# Altium schematic sheet OPA4377 - 副本.SchDoc
size A2
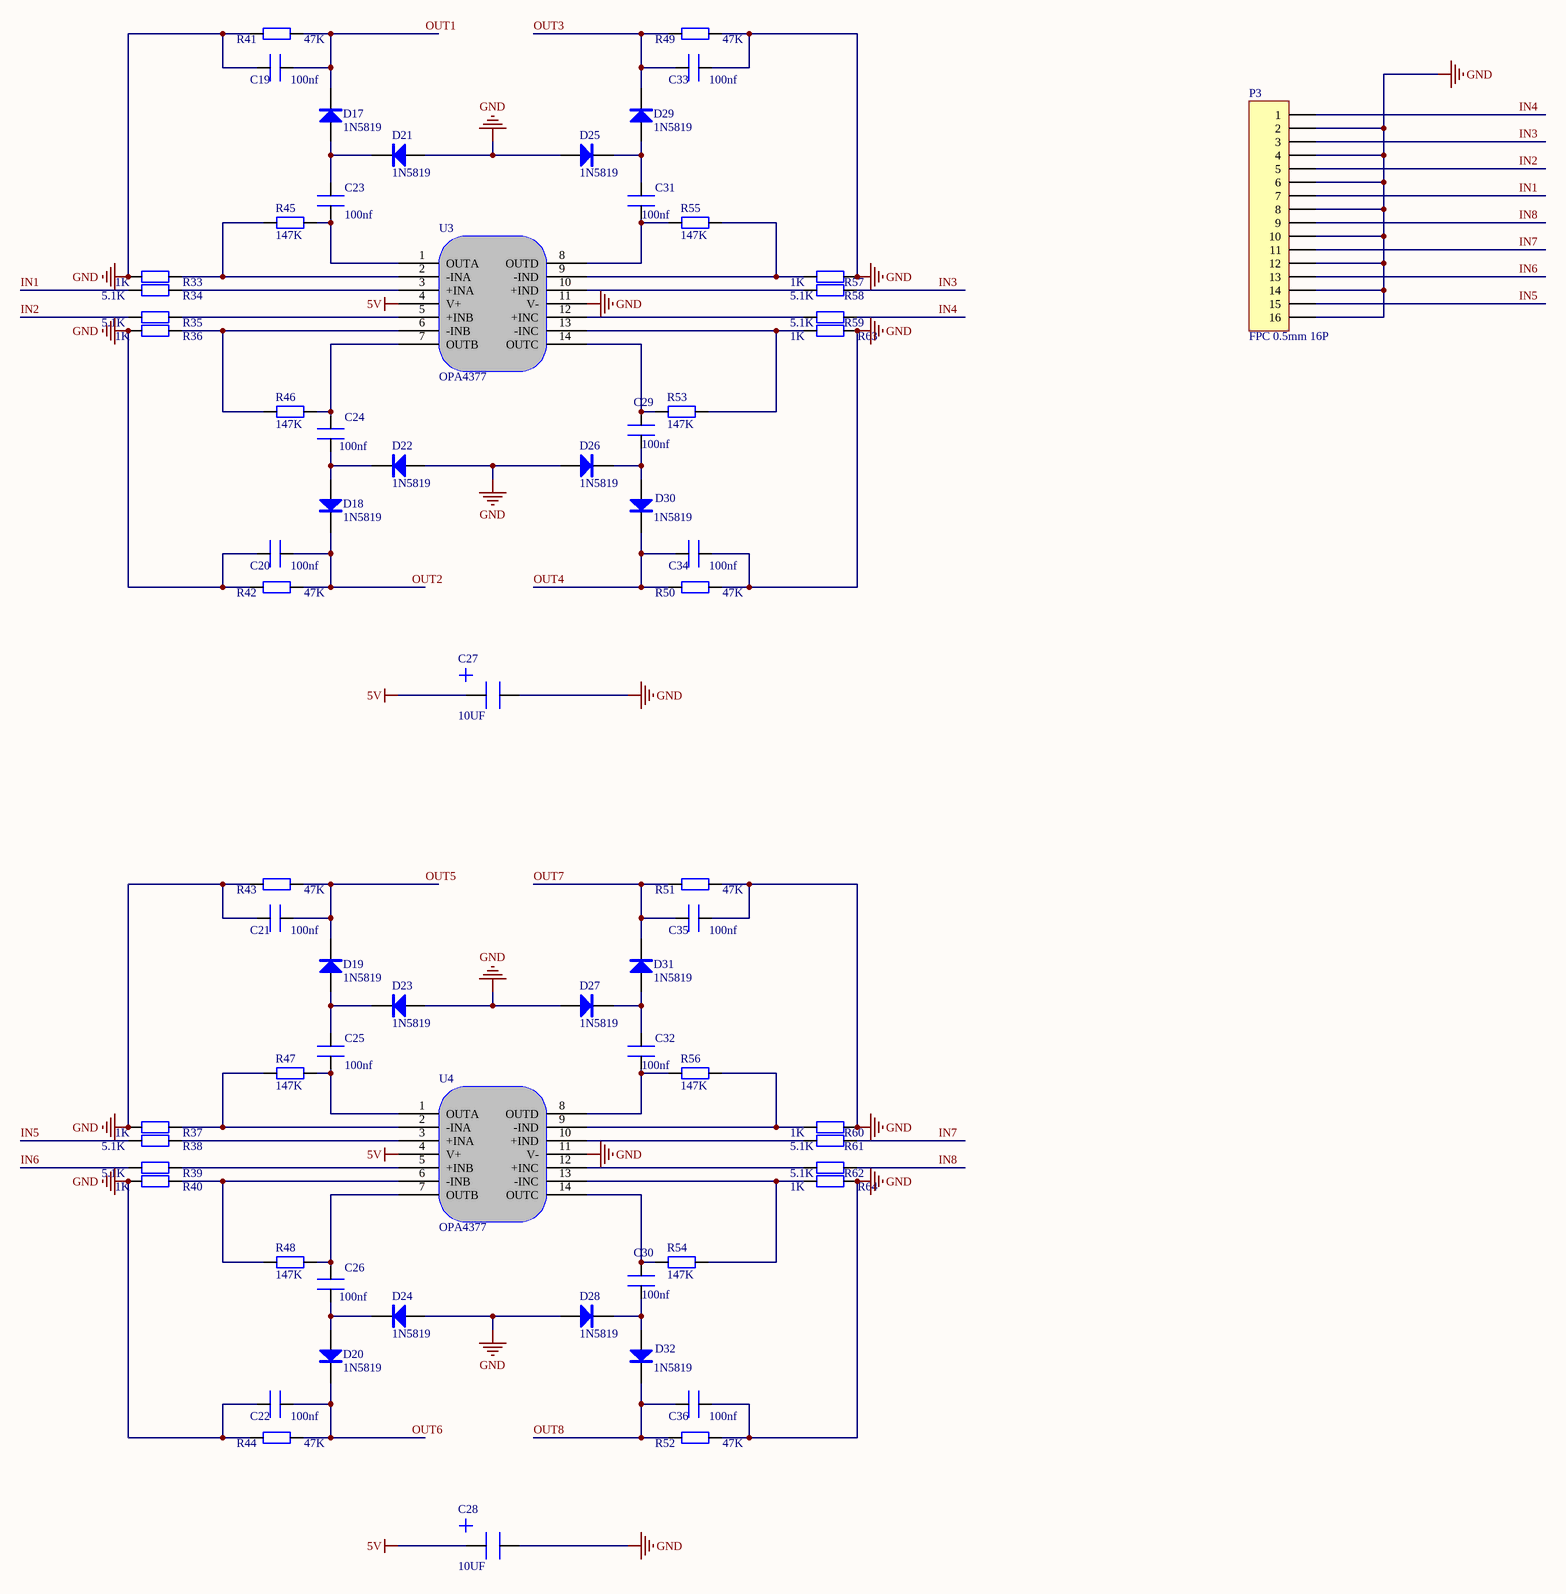
[diagram p0: OPA4377 - 副本.SchDoc]

## Parts
C19  100nf  [C0603]
C20  100nf  [C0603]
C21  100nf  [C0603]
C22  100nf  [C0603]
C23  100nf  [C0603]
C24  100nf  [C0603]
C25  100nf  [C0603]
C26  100nf  [C0603]
C27  10UF  [0805 电容 C3]
C28  10UF  [0805 电容 C3]
C29  100nf  [C0603]
C30  100nf  [C0603]
C31  100nf  [C0603]
C32  100nf  [C0603]
C33  100nf  [C0603]
C34  100nf  [C0603]
C35  100nf  [C0603]
C36  100nf  [C0603]
D17  1N5819  [SOD-523]
D18  1N5819  [SOD-523]
D19  1N5819  [SOD-523]
D20  1N5819  [SOD-523]
D21  1N5819  [SOD-523]
D22  1N5819  [SOD-523]
D23  1N5819  [SOD-523]
D24  1N5819  [SOD-523]
D25  1N5819  [SOD-523]
D26  1N5819  [SOD-523]
D27  1N5819  [SOD-523]
D28  1N5819  [SOD-523]
D29  1N5819  [SOD-523]
D30  1N5819  [SOD-523]
D31  1N5819  [SOD-523]
D32  1N5819  [SOD-523]
P3  FPC 0.5mm 16P  [FPC0.5 2H-WS-16P]
R33  1K  [R0603]
R34  5.1K  [R0603]
R35  5.1K  [R0603]
R36  1K  [R0603]
R37  1K  [R0603]
R38  5.1K  [R0603]
R39  5.1K  [R0603]
R40  1K  [R0603]
R41  47K  [R0603]
R42  47K  [R0603]
R43  47K  [R0603]
R44  47K  [R0603]
R45  147K  [R0603]
R46  147K  [R0603]
R47  147K  [R0603]
R48  147K  [R0603]
R49  47K  [R0603]
R50  47K  [R0603]
R51  47K  [R0603]
R52  47K  [R0603]
R53  147K  [R0603]
R54  147K  [R0603]
R55  147K  [R0603]
R56  147K  [R0603]
R57  1K  [R0603]
R58  5.1K  [R0603]
R59  5.1K  [R0603]
R60  1K  [R0603]
R61  5.1K  [R0603]
R62  5.1K  [R0603]
R63  1K  [R0603]
R64  1K  [R0603]
U3  OPA4377  [TSSOP-14]
U4  OPA4377  [TSSOP-14]

## Nets
5V: C27.1 C28.1 U3.4(V+) U4.4(V+)
GND: C19.2 C20.2 C21.2 C22.2 C27.2 C28.2 C33.1 C34.1 C35.1 C36.1 D21.1(A) D22.1(A) D23.1(A) D24.1(A) D25.1(A) D26.1(A) D27.1(A) D28.1(A) P3.2 P3.4 P3.6 P3.8 P3.10 P3.12 P3.14 P3.16 R33.1 R36.1 R37.1 R40.1 R41.1 R42.1 R43.1 R44.1 R49.2 R50.2 R51.2 R52.2 R57.2 R60.2 R63.2 R64.2 U3.11(V-) U4.11(V-)
IN1: P3.7 R34.1
IN2: P3.5 R35.1
IN3: P3.3 R58.2
IN4: P3.1 R59.2
IN5: P3.15 R38.1
IN6: P3.13 R39.1
IN7: P3.11 R61.2
IN8: P3.9 R62.2
OUT1: C19.1 D17.2(K) R41.2
OUT2: C20.1 D18.2(K) R42.2
OUT3: C33.2 D29.2(K) R49.1
OUT4: C34.2 D30.2(K) R50.1
OUT5: C21.1 D19.2(K) R43.2
OUT6: C22.1 D20.2(K) R44.2
OUT7: C35.2 D31.2(K) R51.1
OUT8: C36.2 D32.2(K) R52.1
NetC23_1: C23.1 R45.2 U3.1(OUTA)
NetC23_2: C23.2 D17.1(A) D21.2(K)
NetC24_1: C24.1 R46.2 U3.7(OUTB)
NetC24_2: C24.2 D18.1(A) D22.2(K)
NetC25_1: C25.1 R47.2 U4.1(OUTA)
NetC25_2: C25.2 D19.1(A) D23.2(K)
NetC26_1: C26.1 R48.2 U4.7(OUTB)
NetC26_2: C26.2 D20.1(A) D24.2(K)
NetC29_1: C29.1 D26.2(K) D30.1(A)
NetC29_2: C29.2 R53.1 U3.14(OUTC)
NetC30_1: C30.1 D28.2(K) D32.1(A)
NetC30_2: C30.2 R54.1 U4.14(OUTC)
NetC31_1: C31.1 R55.1 U3.8(OUTD)
NetC31_2: C31.2 D25.2(K) D29.1(A)
NetC32_1: C32.1 R56.1 U4.8(OUTD)
NetC32_2: C32.2 D27.2(K) D31.1(A)
NetR33_2: R33.2 R45.1 U3.2(-INA)
NetR34_2: R34.2 U3.3(+INA)
NetR35_2: R35.2 U3.5(+INB)
NetR36_2: R36.2 R46.1 U3.6(-INB)
NetR37_2: R37.2 R47.1 U4.2(-INA)
NetR38_2: R38.2 U4.3(+INA)
NetR39_2: R39.2 U4.5(+INB)
NetR40_2: R40.2 R48.1 U4.6(-INB)
NetR53_2: R53.2 R63.1 U3.13(-INC)
NetR54_2: R54.2 R64.1 U4.13(-INC)
NetR55_2: R55.2 R57.1 U3.9(-IND)
NetR56_2: R56.2 R60.1 U4.9(-IND)
NetR58_1: R58.1 U3.10(+IND)
NetR59_1: R59.1 U3.12(+INC)
NetR61_1: R61.1 U4.10(+IND)
NetR62_1: R62.1 U4.12(+INC)

## Library data of the parts
C19-C26 C29-C36 = 100nf  0603 C
C27 C28 = TAN C
D17-D32 = 1N5819: 肖特基二极管; 淘宝ID: 黄晶宝石; 属性: 40V/2A; BOM名称: 肖特基二极管; 欢迎光临: https://shop463601444.taobao.com
P3 = Header 16: Header, 16-Pin; LatestRevisionDate: 17-Jul-2002; LatestRevisionNote: Re-released for DXP Platform.; Publisher: Altium Limited
R33 R36 R37 R40 R57 R60 R63 R64 = 1K 0603 R
R34 R35 R38 R39 R58 R59 R61 R62 = 5.1K 0603 R
R41-R56 = 47K 0603 R